# Altium schematic sheet Memory.SchDoc
size A4; DocumentNumber: 10; SheetNumber: 10; SheetTotal: 12
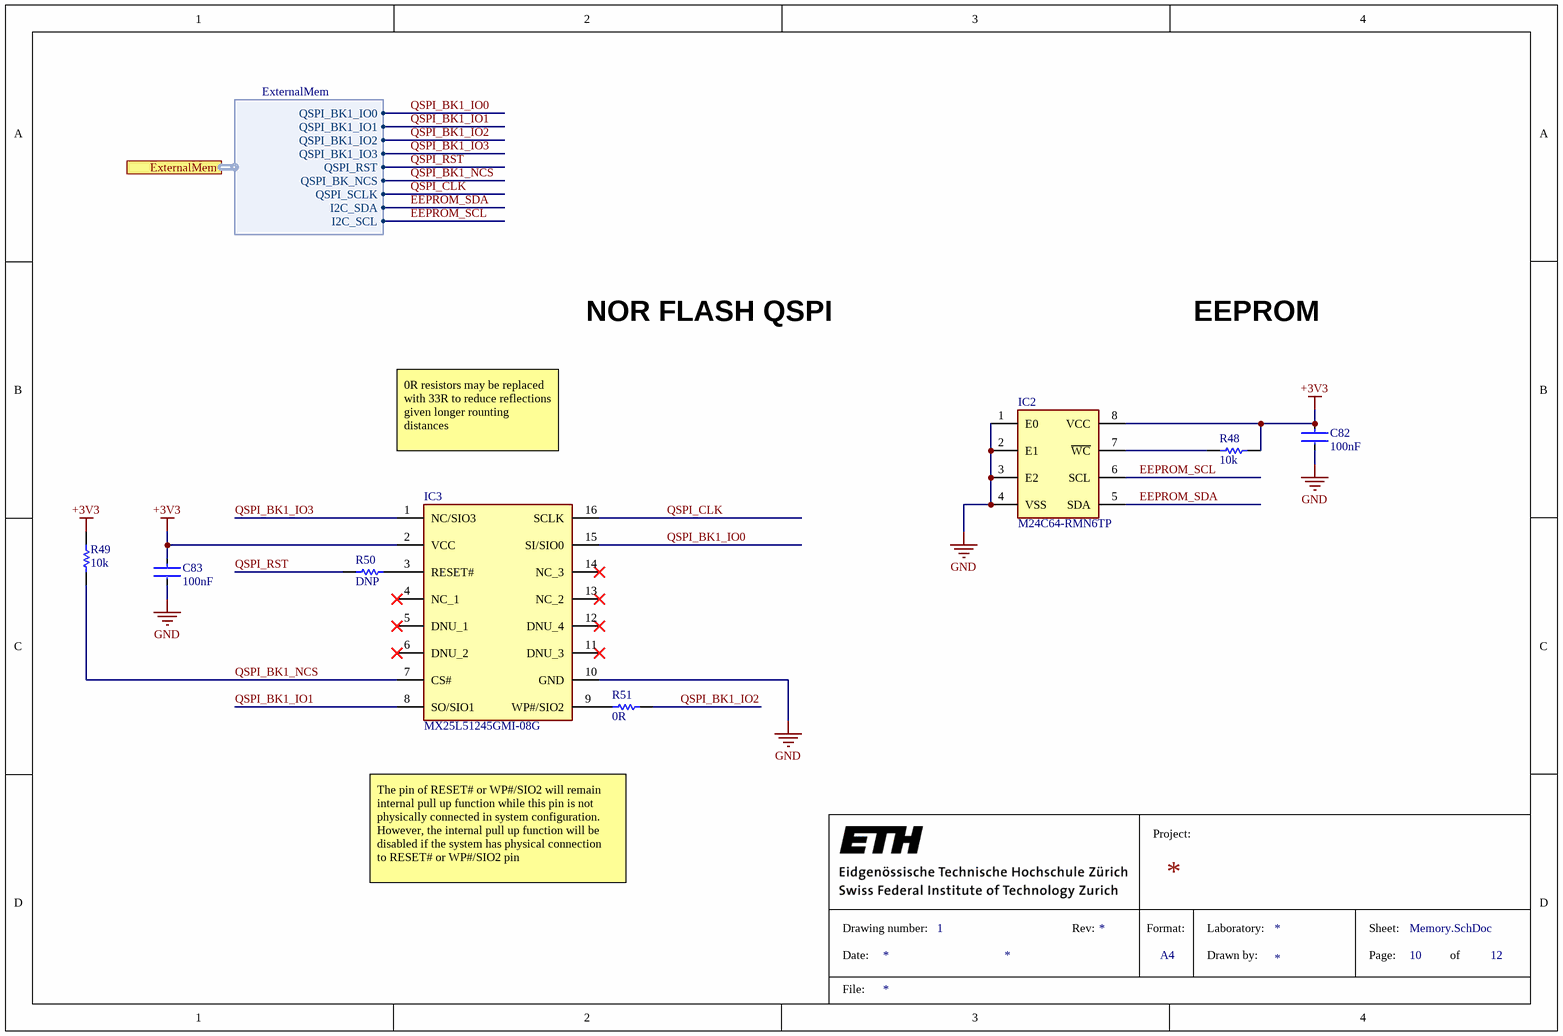
[diagram p0: Memory.SchDoc]

## Parts
C82  100nF  [FP-C0603C-CF-MFG]
C83  100nF  [FP-C0603C-CF-MFG]
IC2  M24C64-RMN6TP  [SOIC127P600X175-8N]
IC3  MX25L51245GMI-08G  [SOIC127P1030X265-16N]
R48  10k  [RESC1005X40X25ML05T05]
R49  10k  [RESC1005X40X25ML05T05]
R50  DNP  [RESC1005X40X25LL05T10]
R51  0R  [RESC1005X40X25LL05T10]

## Ports
ExternalMem (harness ExternalMem, see MAIN[6A], MCU[1C])

## Harnesses
ExternalMem: QSPI_BK1_IO0, QSPI_BK1_IO1, QSPI_BK1_IO2, QSPI_BK1_IO3, QSPI_RST, QSPI_BK_NCS, QSPI_SCLK, I2C_SDA, I2C_SCL

## Nets
+3V3: C82.1 C83.1 IC2.8(VCC) IC3.2(VCC) R48.2 R49.2
GND: C82.2 C83.2 IC2.1(E0) IC2.2(E1) IC2.3(E2) IC2.4(VSS) IC3.10(GND)
EEPROM_SCL: IC2.6(SCL) ; port ExternalMem.I2C_SCL
EEPROM_SDA: IC2.5(SDA) ; port ExternalMem.I2C_SDA
QSPI_BK1_IO0: IC3.15(SI/SIO0) ; port ExternalMem.QSPI_BK1_IO0
QSPI_BK1_IO1: IC3.8(SO/SIO1) ; port ExternalMem.QSPI_BK1_IO1
QSPI_BK1_IO2: R51.2 ; port ExternalMem.QSPI_BK1_IO2
QSPI_BK1_IO3: IC3.1(NC/SIO3) ; port ExternalMem.QSPI_BK1_IO3
QSPI_BK1_NCS: IC3.7(CS#) R49.1 ; port ExternalMem.QSPI_BK_NCS
QSPI_CLK: IC3.16(SCLK) ; port ExternalMem.QSPI_SCLK
QSPI_RST: R50.1 ; port ExternalMem.QSPI_RST
NetIC2_7: IC2.7(~{WC}) R48.1
NetIC3_3: IC3.3(RESET#) R50.2
NetIC3_9: IC3.9(WP#/SIO2) R51.1

Not connected (* = marked no-connect by the designer): IC3 4(NC_1)* 5(DNU_1)* 6(DNU_2)* 11(DNU_3)* 12(DNU_4)* 13(NC_2)* 14(NC_3)*

## Notes on the sheet
- NOR FLASH QSPI
- EEPROM
- 0R resistors may be replaced with 33R to reduce reflections given longer rounting distances
- The pin of RESET# or WP#/SIO2 will remain
  internal pull up function while this pin is not
  physically connected in system configuration.
  However, the internal pull up function will be
  disabled if the system has physical connection
  to RESET# or WP#/SIO2 pin
- Project:
- Drawing number:
- Date:
- 1
- Rev:
- Format:
- A4
- Laboratory:
- Drawn by:
- Sheet:
- Page:
- of
- File:

## Library data of the parts
C82 C83 = CMP-2006-03061-2: Capacitor 100nF 0603; Manufacturer: KEMET; Manufacturer Part Number: C0603C104K5RACTU; Tolerance: 0.1; Temperature Coefficient: 30ppm/°C; Material: Ceramic; Automotive Grade: Grade 1; Voltage Rating: 50 V; Value: 0.10 μF; Temperature Characteristic: X7R; Temperature: -55°C to +125°C; RoHS: TRUE; Temperature Range High: +125°C; Lead Free: Yes; Octopart: https://octopart.com/c0603c104k5ractu-kemet-139244; Digikey Description: CAP CER 0.1UF 50V X7R 0603; Category: Cap; Package: C0603C-CF; ComponentLink2Description: Datasheet; Temperature Range Low: -55°C; Device Class L1: Passive Components; Automotive: Yes; Device Class L3: Ceramic Capacitors; ComponentLink2URL: https://api.kemet.com/component-edge/download/datasheet/C0603C100J5GACAUTO.pdf; Capacitance: 0.10 μF; Device Class L2: Capacitors; Height: 0.87mm; Supplier 1: Mouser; Supplier Part Number 1: 80-C0603C104K5R7867
IC2 = M24C64-FMN6TP: EEPROM ST 64kbit I2C; Manufacturer_Name: STMicroelectronics; Datasheet Link: https://www.st.com/resource/en/datasheet/m24c64-f.pdf; Height: 1.75mm; Mouser Part Number: 511-M24C64-RMN6TP; Mouser Price/Stock: https://www.mouser.co.uk/ProductDetail/STMicroelectronics/M24C64-FMN6TP?qs=bKyP%252BnDORLFSmkTpM6wmYg%3D%3D; Arrow Part Number: M24C64-RMN6TP; Arrow Price/Stock: https://www.arrow.com/en/products/m24c64-fmn6tp/stmicroelectronics?utm_currency=USD&region=europe; Manufacturer Part Number: M24C64-RMN6TP
IC3 = MX25L51245GMI-08G: NOR Flahs 512MBit QSPI Macronix; Datasheet Link: https://datasheet.datasheetarchive.com/originals/dk/DKDS-14/274585.pdf; Height: 2.65mm; Manufacturer_Name: Macronix; Manufacturer Part Number: MX25L51245GMI-08G; Arrow Part Number: MX25L51245GMI-08G; Arrow Price/Stock: https://www.arrow.com/en/products/mx25l51245gmi-08g/macronix-international?region=nac
R48 R49 = CMP-2002-00433-1: Resistor 10k 0402; Manufacturer Part Number: ERJ-2GEJ103X; Manufacturer: Panasonic; Supplier 1: Mouser; Supplier Part Number 1: 667-ERJ-2GEJ103X
R50 R51 = CMP-2002-03041-1: Resistor 0R 0402; Part Number: CRCW04020000Z0EDHP; Manufacturer: Vishay Dale; Value: 0Ohm; Voltage Rating: 50V; Power Rating: 200mW; Temperature Coefficient: 0ppm/°C; Max Power Dissipation: 125mW; Supplier 1: Digi-Key; Supplier Part Number 1: 541-0.0YBCT-ND; Manufacturer Part Number: CRCW04020000Z0EDHP; RoHS: Yes; Category: Chip SMD Resistors; Stock 1: 527407; Pricing 1: 1=0.13000, 10=0.11300, 25=0.07840, 50=0.06080, 100=0.04350, 250=0.03388, 500=0.02694, 1000=0.01912, 5000=0.01477 (USD); Mount: Surface Mount; Case/Package: 0402; Weight: 2.3E-05oz; Case Code (Metric): 1005; Case Code (Imperial): 0402; Contact Plating: Tin; Min Operating Temperature: -55°C; Max Operating Temperature: 155°C; Packaging: Tape and Reel; Composition: Thick Film; Termination: SMD/SMT; Voltage Rating (DC): 50V; Package Quantity: 1; Military Standard: Not; Number of Terminations: 2; Features: Automotive AEC-Q200; Length: 1mm; Height: 0.3mm; Width: 0.02inch; Depth: 0.5mm; Radiation Hardening: No; REACH SVHC: Unknown; Lead Free: Lead Free; ComponentLink1URL: https://datasheet.ciiva.com/16494/crcwhpe3-16494453.pdf?src-supplier=Future+Electronics; ComponentLink1Description: https://datasheet.ciiva.com/16494/crcwhpe3-16494453.pdf?src-supplier=Future+Electronics; ComponentLink2URL: https://datasheet.ciiva.com/2470/crcwhpe3-2470555.pdf?src-supplier=Digi-Key; ComponentLink2Description: https://datasheet.ciiva.com/2470/crcwhpe3-2470555.pdf?src-supplier=Digi-Key; ComponentLink3URL: https://datasheet.ciiva.com/5562/crcwhpe3-46056-5562315.pdf?src-supplier=Mouser; ComponentLink3Description: https://datasheet.ciiva.com/5562/crcwhpe3-46056-5562315.pdf?src-supplier=Mouser; ComponentLink4URL: https://datasheet.ciiva.com/9109/crcwhpe3-9109963.pdf?src-supplier=Avnet; ComponentLink4Description: https://datasheet.ciiva.com/9109/crcwhpe3-9109963.pdf?src-supplier=Avnet; ComponentLink5URL: https://datasheet.ciiva.com/2470/crcwhpe3-2470556.pdf?src-supplier=Digi-Key; ComponentLink5Description: https://datasheet.ciiva.com/2470/crcwhpe3-2470556.pdf?src-supplier=Digi-Key; ComponentLink6URL: https://datasheet.ciiva.com/28621/1912814-28621324.pdf?src-supplier=Element14; ComponentLink6Description: https://datasheet.ciiva.com/28621/1912814-28621324.pdf?src-supplier=Element14; ComponentLink7URL: https://datasheet.ciiva.com/2470/crcwhpe3-2470557.pdf?src-supplier=Digi-Key; ComponentLink7Description: https://datasheet.ciiva.com/2470/crcwhpe3-2470557.pdf?src-supplier=Digi-Key; ComponentLink8URL: https://datasheet.ciiva.com/7725/crcwhpe3-7725758.pdf?src-supplier=Element14; ComponentLink8Description: https://datasheet.ciiva.com/7725/crcwhpe3-7725758.pdf?src-supplier=Element14